# Altium schematic sheet Accelerometers.SchDoc: =DT_SCH_Title
size A4; Organization: Droid Technologies; SheetNumber: 8; SheetTotal: 14
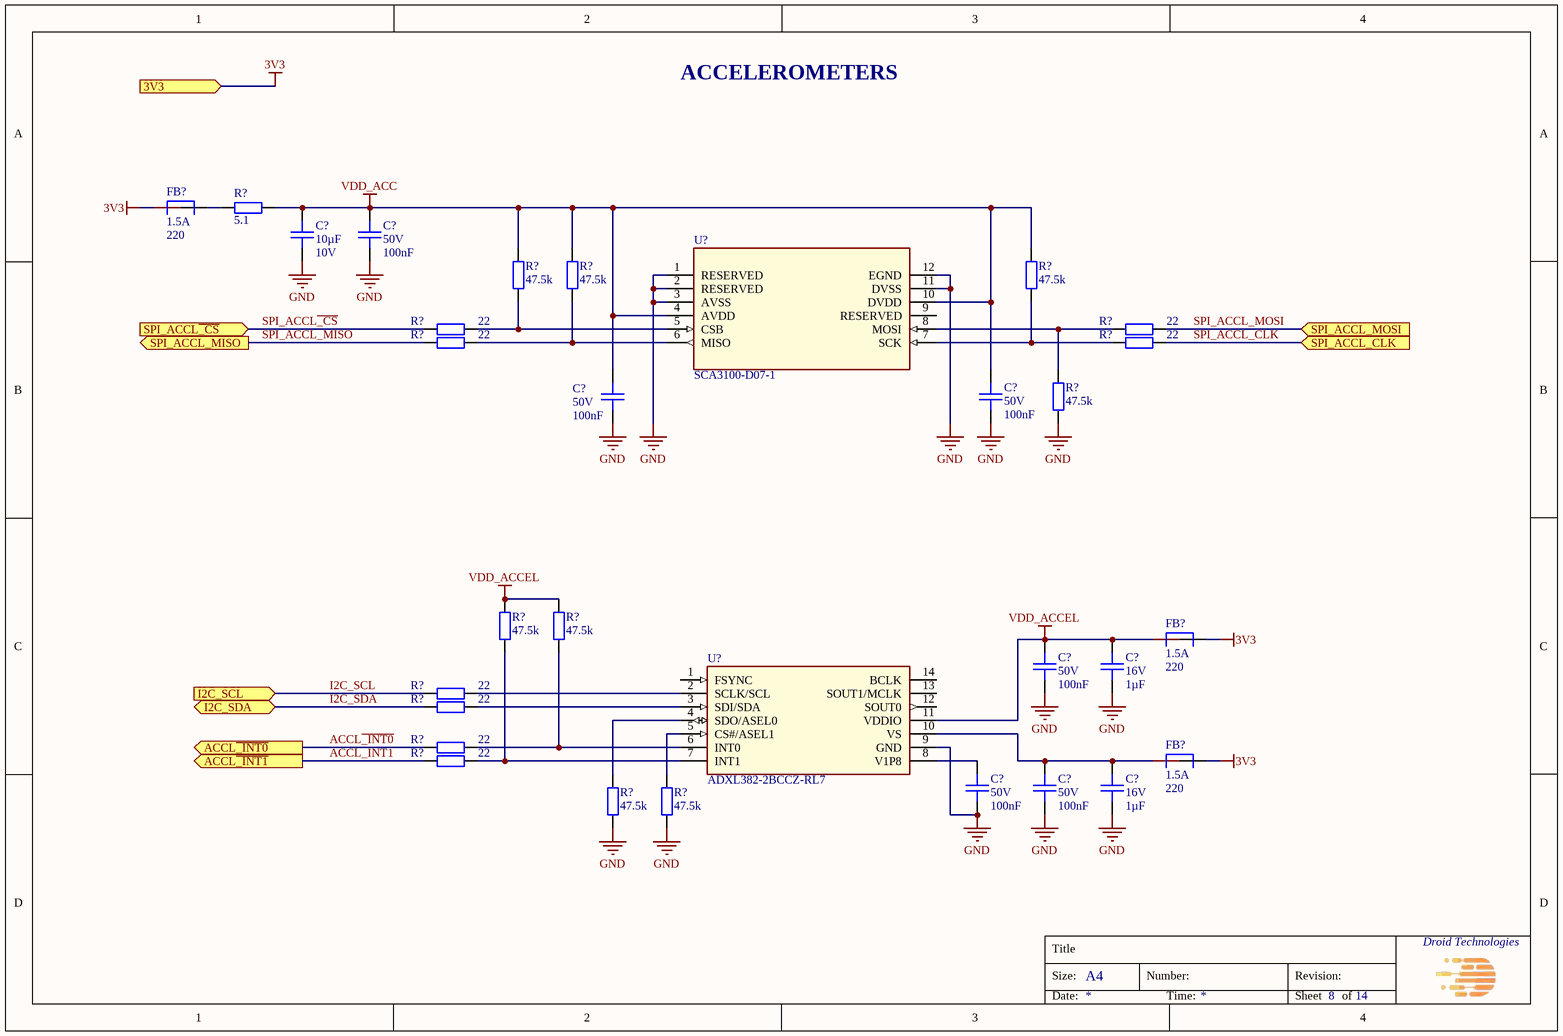
[diagram p0: Accelerometers.SchDoc]

## Parts
(Parts that share a designator on the sheet are numbered #1, #2 ... from top to bottom, then left to right.)
C?#1  Capacitance: 10µF  Voltage Rating: 10V  [CAPC200X125X145L50]  (hidden comment: CGA4J1X8L1A106K125AC)
C?#2  Voltage Rating: 50V  Capacitance: 100nF  [CAPC100x50x50L25]  (hidden comment: GCM155L8EH104KE07D)
C?#3  Voltage Rating: 50V  Capacitance: 100nF  [CAPC100x50x50L25]  (hidden comment: GCM155L8EH104KE07D)
C?#4  Voltage Rating: 50V  Capacitance: 100nF  [CAPC100x50x50L25]  (hidden comment: GCM155L8EH104KE07D)
C?#5  Voltage Rating: 50V  Capacitance: 100nF  [CAPC100x50x50L25]  (hidden comment: GCM155L8EH104KE07D)
C?#6  Voltage Rating: 16V  Capacitance: 1µF  [CAPC160X80X90L35]  (hidden comment: GCG188L8EE105KA07D)
C?#7  Voltage Rating: 50V  Capacitance: 100nF  [CAPC100x50x50L25]  (hidden comment: GCM155L8EH104KE07D)
C?#8  Voltage Rating: 50V  Capacitance: 100nF  [CAPC100x50x50L25]  (hidden comment: GCM155L8EH104KE07D)
C?#9  Voltage Rating: 16V  Capacitance: 1µF  [CAPC160X80X90L35]  (hidden comment: GCG188L8EE105KA07D)
FB?#1  Imax: 1.5A  Impedance: 220  [BEADC160X80X95L40]  (hidden comment: BLM18KG221BH1D)
FB?#2  Imax: 1.5A  Impedance: 220  [BEADC160X80X95L40]  (hidden comment: BLM18KG221BH1D)
FB?#3  Imax: 1.5A  Impedance: 220  [BEADC160X80X95L40]  (hidden comment: BLM18KG221BH1D)
R?#1  Resistance: 5.1  [RESC100X50X40L25]  (hidden comment: RC0402FR-075R1L)
R?#2  Resistance: 47.5k  [RESC100X50X40L25]  (hidden comment: RC0402FR-0747K5L)
R?#3  Resistance: 47.5k  [RESC100X50X40L25]  (hidden comment: RC0402FR-0747K5L)
R?#4  Resistance: 47.5k  [RESC100X50X40L25]  (hidden comment: RC0402FR-0747K5L)
R?#5  Resistance: 22  [RESC100X50X40L25]  (hidden comment: RC0402FR-0722RL)
R?#6  Resistance: 22  [RESC100X50X40L25]  (hidden comment: RC0402FR-0722RL)
R?#7  Resistance: 22  [RESC100X50X40L25]  (hidden comment: RC0402FR-0722RL)
R?#8  Resistance: 22  [RESC100X50X40L25]  (hidden comment: RC0402FR-0722RL)
R?#9  Resistance: 47.5k  [RESC100X50X40L25]  (hidden comment: RC0402FR-0747K5L)
R?#10  Resistance: 47.5k  [RESC100X50X40L25]  (hidden comment: RC0402FR-0747K5L)
R?#11  Resistance: 47.5k  [RESC100X50X40L25]  (hidden comment: RC0402FR-0747K5L)
R?#12  Resistance: 22  [RESC100X50X40L25]  (hidden comment: RC0402FR-0722RL)
R?#13  Resistance: 22  [RESC100X50X40L25]  (hidden comment: RC0402FR-0722RL)
R?#14  Resistance: 22  [RESC100X50X40L25]  (hidden comment: RC0402FR-0722RL)
R?#15  Resistance: 22  [RESC100X50X40L25]  (hidden comment: RC0402FR-0722RL)
R?#16  Resistance: 47.5k  [RESC100X50X40L25]  (hidden comment: RC0402FR-0747K5L)
R?#17  Resistance: 47.5k  [RESC100X50X40L25]  (hidden comment: RC0402FR-0747K5L)
U?#1  SCA3100-D07-1  [SCA3100-D07-1]
U?#2  ADXL382-2BCCZ-RL7  [14-LGA (2.9x2.8)]

## Ports
3V3 (in), ACCL~{_INT0} (out), ACCL~{_INT1} (out), I2C_SCL (in), I2C_SDA (bidir), SPI_ACCL_CLK (in), SPI_ACCL_MISO (out), SPI_ACCL_MOSI (in), SPI_ACCL~{_CS} (in)

## Nets
3V3: FB?#1.1 FB?#2.2 FB?#3.2 ; port 3V3
GND: C?#1.1 C?#2.1 C?#3.1 C?#4.1 C?#5.1 C?#6.1 C?#7.1 C?#8.1 C?#9.1 R?#9.1 R?#16.1 R?#17.1 U?#1.1(RESERVED) U?#1.2(RESERVED) U?#1.3(AVSS) U?#1.11(DVSS) U?#1.12(EGND) U?#2.9(GND)
VDD_ACC: C?#1.2 C?#2.2 C?#3.2 C?#4.2 R?#1.2 R?#2.2 R?#3.2 R?#4.2 U?#1.4(AVDD) U?#1.10(DVDD)
VDD_ACCEL: C?#5.2 C?#6.2 FB?#2.1 R?#10.2 R?#11.2 U?#2.11(VDDIO)
ACCL~{_INT0}: R?#14.1 ; port ACCL~{_INT0}
ACCL~{_INT1}: R?#15.1 ; port ACCL~{_INT1}
I2C_SCL: R?#12.1 ; port I2C_SCL
I2C_SDA: R?#13.1 ; port I2C_SDA
SPI_ACCL~{_CS}: R?#5.1 ; port SPI_ACCL~{_CS}
SPI_ACCL_CLK: R?#8.2 ; port SPI_ACCL_CLK
SPI_ACCL_MISO: R?#7.1 ; port SPI_ACCL_MISO
SPI_ACCL_MOSI: R?#6.2 ; port SPI_ACCL_MOSI
NetC?#7_2: C?#7.2 U?#2.8(V1P8)
NetC?#8_2: C?#8.2 C?#9.2 FB?#3.1 U?#2.10(VS)
NetFB?#1_2: FB?#1.2 R?#1.1
NetR?#2_1: R?#2.1 R?#5.2 U?#1.5(CSB)
NetR?#3_1: R?#3.1 R?#7.2 U?#1.6(MISO)
NetR?#4_1: R?#4.1 R?#8.1 U?#1.7(SCK)
NetR?#6_1: R?#6.1 R?#9.2 U?#1.8(MOSI)
NetR?#10_1: R?#10.1 R?#15.2 U?#2.7(INT1)
NetR?#11_1: R?#11.1 R?#14.2 U?#2.6(INT0)
NetR?#12_2: R?#12.2 U?#2.2(SCLK/SCL)
NetR?#13_2: R?#13.2 U?#2.3(SDI/SDA)
NetR?#16_2: R?#16.2 U?#2.4(SDO/ASEL0)
NetR?#17_2: R?#17.2 U?#2.5(CS#/ASEL1)

Not connected (* = marked no-connect by the designer): U?#1 9(RESERVED); U?#2 1(FSYNC) 12(SOUT0) 13(SOUT1/MCLK) 14(BCLK)

## Notes on the sheet
- ACCELEROMETERS
- Title
- Size:
- A4
- Number:
- Revision:
- Date:
- Time:
- Sheet
- of

## Library data of the parts
C?#1 = CMP-001-1984-1: CAP CER 10UF 10V X8L 0805; Manufacturer: TDK Corporation; Tolerance: 10%; Op Temp min: -55°C; Op Temp max: 150°C; ComponentLink3Description: Digikey; Mounting Type: SM; Ratings: AEC-Q200; ComponentLink1Description: Datasheet; ComponentLink3URL: https://www.digikey.com/en/products/detail/tdk-corporation/CGA4J1X8L1A106K125AC/9991388; Lead Spacing: 0mm; MPN: CGA4J1X8L1A106K125AC; Size: 2.00mm x 1.25mm; Height max: 1.5mm; ComponentLink2URL: https://eu.mouser.com/ProductDetail/TDK/CGA4J1X8L1A106K125AC?qs=gZXFycFWdANzH%252B2UvJJjtQ%3D%3D; Package: 0805 (2012 Metric); ComponentLink2Description: Mouser; Dielectric: X8L; ComponentLink1URL: https://product.tdk.com/system/files/dam/doc/product/capacitor/ceramic/mlcc/catalog/mlcc_automotive_hightemp_en.pdf
C?#2-C?#5 C?#7 C?#8 = CMP-001-1980-1: CAP CER 0.1UF 50V X8L 0402; Manufacturer: Murata Electronics; Op Temp max: 150°C; Op Temp min: -55°C; Tolerance: 10%; Height max: 550µm; ComponentLink3Description: Digikey; Mounting Type: SM; ComponentLink3URL: https://www.digikey.com/en/products/detail/murata-electronics/GCM155L8EH104KE07D/11618823; Package: 0402 (1005 Metric); Lead Spacing: 0mm; MPN: GCM155L8EH104KE07D; Size: 1.00mm x 0.50mm; Ratings: AEC-Q200; ComponentLink1URL: https://search.murata.co.jp/Ceramy/image/img/A01X/G101/ENG/GCM155L8EH104KE07-01.pdf; ComponentLink1Description: Datasheet; Dielectric: X8L; ComponentLink2Description: Mouser; ComponentLink2URL: https://eu.mouser.com/ProductDetail/Murata-Electronics/GCM155L8EH104KE07D?qs=1mbolxNpo8fQSHf0HYnZWw%3D%3D
C?#6 C?#9 = CMP-001-1982-1: CAP CER 1UF 16V X8L 0603; Manufacturer: Murata Electronics; Tolerance: 10%; Op Temp min: -55°C; Op Temp max: 150°C; ComponentLink3URL: https://www.digikey.com/en/products/detail/murata-electronics/GCG188L8EE105KA07D/10695125; Package: 0603 (1608 Metric); MPN: GCG188L8EE105KA07D; ComponentLink2URL: https://eu.mouser.com/ProductDetail/Murata-Electronics/GCG188L8EE105KA07D?qs=rrS6PyfT74dFMfTR80dVTA%3D%3D; Dielectric: X8L; Size: 1.60mm x 0.80mm; ComponentLink1Description: Datasheet; ComponentLink1URL: https://search.murata.co.jp/Ceramy/image/img/A01X/G101/ENG/GCG188L8EE105KA07-01.pdf; ComponentLink2Description: Mouser; Height max: 900µm; Mounting Type: SM; ComponentLink3Description: Digikey; Lead Spacing: 0mm; Ratings: AEC-Q200
FB?#1-FB?#3 = CMP-001-1981-1: FERRITE BEAD 220 OHM 0603 1LN; Manufacturer: Murata Electronics; DCR: 50m; Op Temp min: -55°C; Frequency: 100MHz; Op Temp max: 150°C; Number of Lines: 1; Mounting Type: SM; Size: 1.60mm x 0.80mm; ComponentLink2URL: https://eu.mouser.com/ProductDetail/Murata-Electronics/BLM18KG221BH1D?qs=sJ5gq5MLFXpgEHYBdWUtkQ%3D%3D; ComponentLink1Description: Datasheet; ComponentLink1URL: https://www.murata.com/en-us/products/productdata/8798137286686/QNFA9129.pdf; Lead Spacing: 0mm; Ratings: AEC-Q200; ComponentLink3Description: Digikey; ComponentLink3URL: https://www.digikey.com/en/products/detail/murata-electronics/BLM18KG221BH1D/6156000; Height max: 950µm; Package: 0603 (1608 Metric); ComponentLink2Description: Mouser; MPN: BLM18KG221BH1D
R?#1 = CMP-00125-8: RES 5.1 OHM 1% 1/16W 0402; Manufacturer: YAGEO; Power: 63mW; Temperature Coefficient: ±200ppm; Op Temp max: 155°C; Op Temp min: -55°C; ComponentLink3URL: https://www.digikey.com/en/products/detail/yageo/RC0402FR-075R1L/5917722; ComponentLink2Description: Mouser; ComponentLink2URL: https://eu.mouser.com/ProductDetail/YAGEO/RC0402FR-075R1L?qs=%2Fha2pyFaduhjtLcYvKXQ8B9EFTm6YmMloHxcmTFokS12j5yrT26S1A%3D%3D; Size: 1.00mm x 0.50mm; ComponentLink3Description: Digikey; Package: 0402 (1005 Metric); Ratings: -; Tolerance: 1%; MPN: RC0402FR-075R1L; ComponentLink1URL: https://www.yageo.com/upload/media/product/productsearch/datasheet/rchip/PYu-RC_Group_51_RoHS_L_12.pdf; Mounting Type: SM; Composition: Thick Film; Height max: 400µm; ComponentLink1Description: Datasheet
R?#2-R?#4 R?#9-R?#11 R?#16 R?#17 = CMP-001-0277-7: RES 47.5K OHM 1% 1/16W 0402; Manufacturer: YAGEO; Op Temp min: -55°C; Power: 63mW; Temperature Coefficient: ±100ppm; Op Temp max: 155°C; ComponentLink1URL: https://www.yageo.com/upload/media/product/productsearch/datasheet/rchip/PYu-RC_Group_51_RoHS_L_12.pdf; ComponentLink1Description: Datasheet; MPN: RC0402FR-0747K5L; ComponentLink3Description: Digikey; ComponentLink2URL: https://eu.mouser.com/ProductDetail/YAGEO/RC0402FR-0747K5L?qs=V1yeUXFNrklfu86Rfgihxg%3D%3D; Mounting Type: SM; Tolerance: 1%; Package: 0402 (1005 Metric); Height max: 400µm; ComponentLink2Description: Mouser; ComponentLink3URL: https://www.digikey.com/en/products/detail/yageo/RC0402FR-0747K5L/726617; Size: 1.00mm x 0.50mm; Composition: Thick Film; Ratings: -
R?#5-R?#8 R?#12-R?#15 = CMP-001-0482-4: RES 22 OHM 1% 1/16W 0402; Manufacturer: YAGEO; Temperature Coefficient: ±100ppm; Op Temp max: 155°C; Op Temp min: -55°C; Power: 63mW; Ratings: -; ComponentLink3URL: https://www.digikey.com/en/products/detail/yageo/RC0402FR-0722RL/726562; ComponentLink2URL: https://eu.mouser.com/ProductDetail/YAGEO/RC0402FR-0722RL?qs=V1yeUXFNrkkRg6zf08ADKQ%3D%3D; MPN: RC0402FR-0722RL; ComponentLink1Description: Datasheet; ComponentLink3Description: Digikey; Tolerance: 1%; Size: 1.00mm x 0.50mm; ComponentLink1URL: https://www.yageo.com/upload/media/product/productsearch/datasheet/rchip/PYu-RC_Group_51_RoHS_L_12.pdf; Composition: Thick Film; ComponentLink2Description: Mouser; Mounting Type: SM; Package: 0402 (1005 Metric); Height max: 400µm
U?#1 = SCA3100-D07-1: ACCELEROMETER 6G SPI 12SMD; Manufacturer: Murata Electronics; MPN: SCA3100-D07-1
U?#2 = ADXL382-2BCCZ-RL7: Accelerometer X, Y, Z Axis ±15g, 30g, 60g 50Hz ~ 8kHz 14-LGA (2.9x2.8); Manufacturer: Analog Devices Inc.; MPN: ADXL382-2BCCZ-RL7